# EAGLE design EPGinputRelayA-PIN (EAGLE 7.7.0)
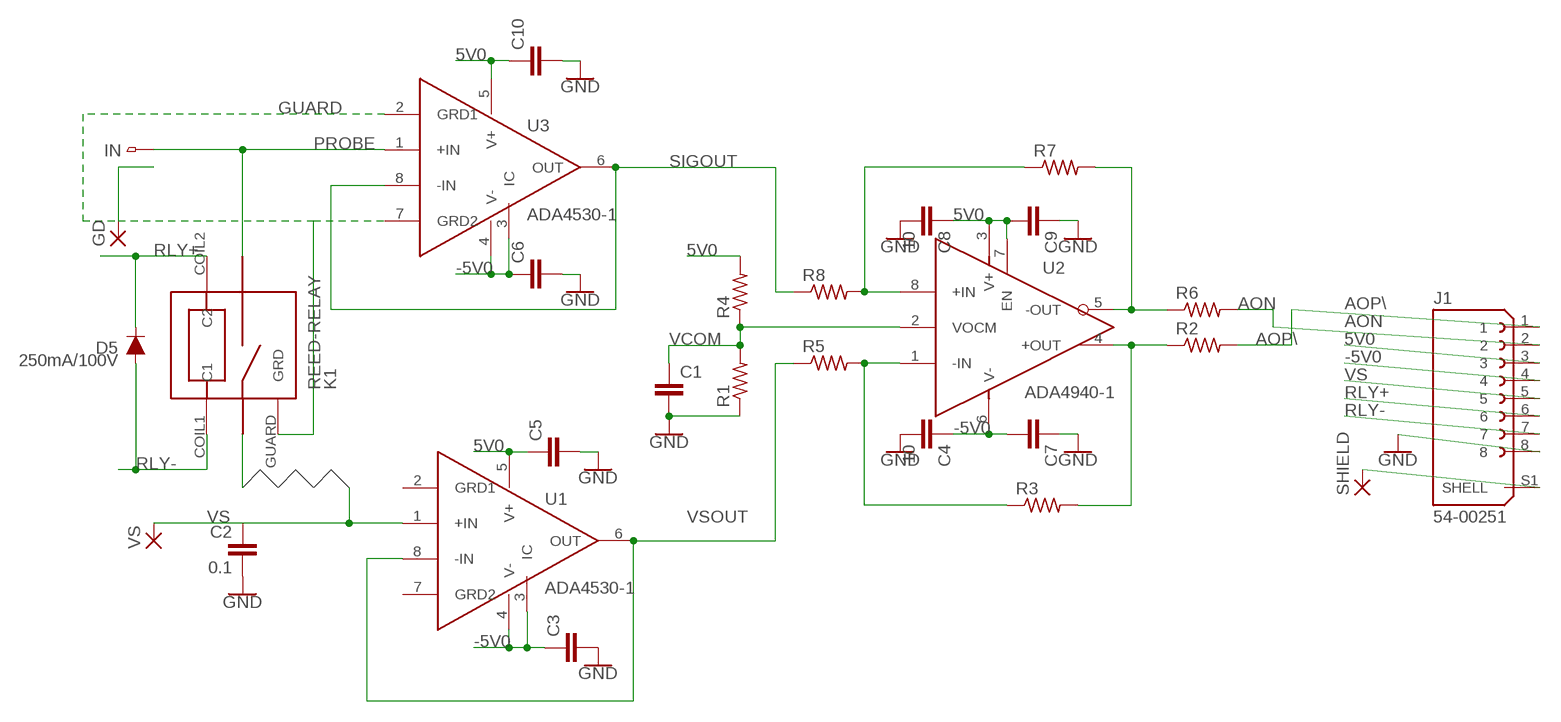
[diagram p0: schematic, sheet 1]

## Parts
C1  CAPS0603S  [0603S]
C2  0.1  CAPS0603S  [0603S]
C3  CAPS0603S  [0603S]
C4  10  CAPS1206S  [1206S]
C5  CAPS0603S  [0603S]
C6  CAPS0603S  [0603S]
C7  CAPS0603S  [0603S]
C8  10  CAPS1206S  [1206S]
C9  CAPS0603S  [0603S]
C10  CAPS0603S  [0603S]
D5  250mA/100V  DIODE-BAS16J  [SOD-323]
GD  2,15/1,0  [2,15/1,0]
IN  PADPAD150  [PAD-150SQ]
J1  54-00251  [54-00251]
K1  REED-RELAY  [MRE05]
R1  RESISTOR_SM0805S  [0805S]
R2  RESISTOR_SM0805S  [0805S]
R3  RESISTOR_SM0805S  [0805S]
R4  RESISTOR_SM0805S  [0805S]
R5  RESISTOR_SM0805S  [0805S]
R6  RESISTOR_SM0805S  [0805S]
R7  RESISTOR_SM0805S  [0805S]
R8  RESISTOR_SM0805S  [0805S]
SHIELD  2,15/1,0  [2,15/1,0]
U1  ADA4530-1  [SOIC-8]
U2  ADA4940-1  [SOIC-8]
U3  ADA4530-1  [SOIC-8]
VS  2,15/1,0  [2,15/1,0]

## Nets
5V0: C5.1 C8.1 C9.2 C10.1 J1.3 R4.2 U1.5(V+) U2.3(V+) U2.7(EN) U3.5(V+)
-5V0: C3.1 C4.1 C6.1 C7.2 J1.4 U1.3(IC) U1.4(V-) U2.6(V-) U3.3(IC) U3.4(V-)
AON: J1.2 R6.2
AOP\: J1.1 R2.2
GND: C1.2 C2.2 C3.2 C4.2 C5.2 C6.2 C7.1 C8.2 C9.1 C10.2 J1.8 R1.1
GUARD: GD.1(P) K1.GUARD(GRD) U3.2(GRD1) U3.7(GRD2)
N$2: J1.S1(SHELL) SHIELD.1(P)
N$6: R7.1 R8.2 U2.8(+IN)
N$7: R3.1 R5.2 U2.1(-IN)
N$19: R2.1 R3.2 U2.4(+OUT)
N$20: R6.1 R7.2 U2.5(-OUT)
PROBE: IN.P$1 U3.1(+IN)
RLY+: D5.C J1.6 K1.COIL2(C2)
RLY-: D5.A J1.7 K1.COIL1(C1)
SIGOUT: R8.1 U3.6(OUT) U3.8(-IN)
VCOM: C1.1 R1.2 R4.1 U2.2(VOCM)
VS: C2.1 J1.5 U1.1(+IN) VS.1(P)
VSOUT: R5.1 U1.6(OUT) U1.8(-IN)
Unconnected: U1.2(GRD1) U1.7(GRD2)

## Library data of the parts
C1-C10 = STEVES_BU:CAPS
D5 = SparkFun-DiscreteSemi:DIODE: Diode These are standard reverse protection diodes and small signal diodes. SparkFun Products: SparkFun SparkPunk Sound Kit <https://www.sparkfun.com/products/11177> SparkFun ESP8266 Thing <https://www.sparkfun.com/products/13231>; PROD_ID: DIO-09646
GD SHIELD VS = wirepad:2,15/1,0: THROUGH-HOLE PAD
IN = jETPAK-ASM:PAD
J1 = 54-00248:54-00251
K1 = EPGinput:REED-RELAY
R1-R8 = STEVES_BU:RESISTOR_SM
U1 U3 = EPG:ADA4530-1
U2 = EPG:ADA4940-1

## Board
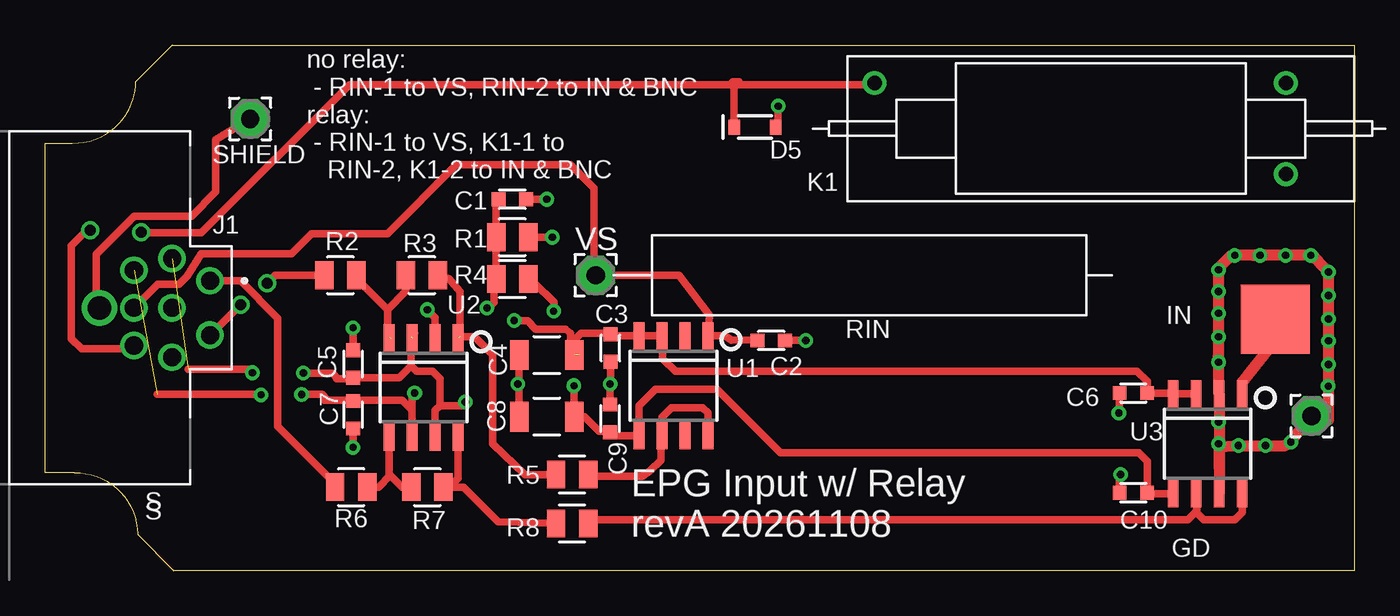
[diagram p1: board, top side]
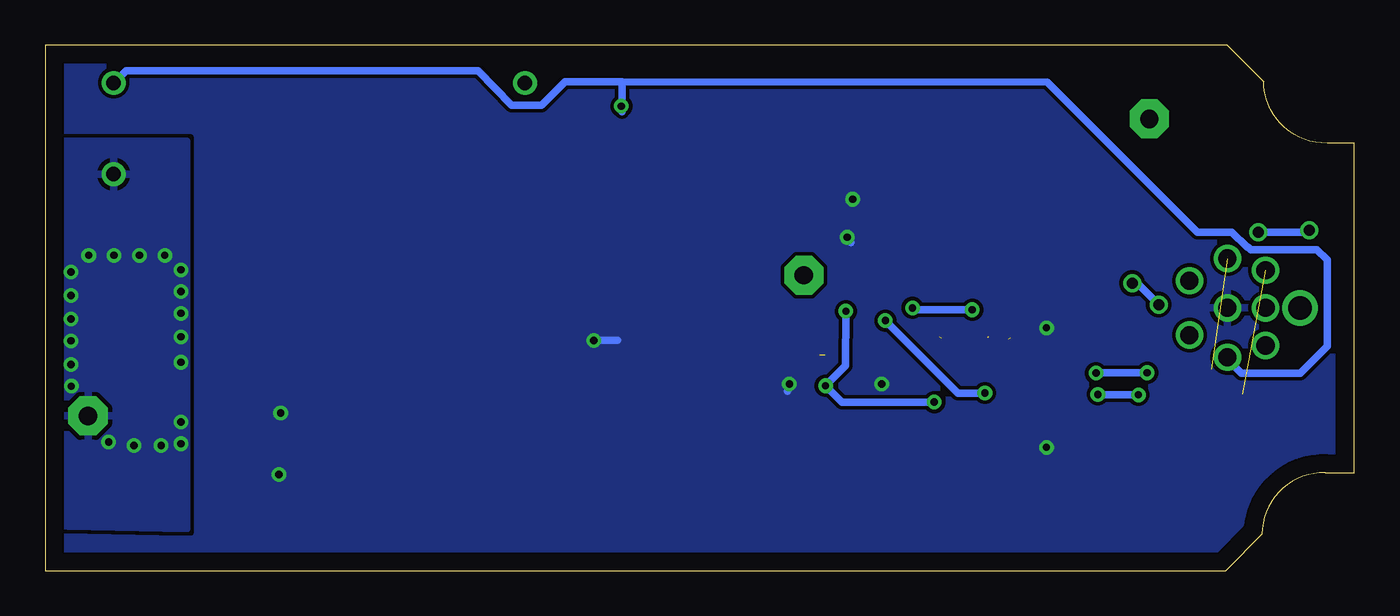
[diagram p2: board, bottom side, seen from below]

Size 72.3 x 29 mm. Coordinates in mm from the lower left corner, seen from the top.
Outline: 0,5.4 0,23.6 1.5,23.6 arc91 5,27 7,29 72.3,29 72.3,0 7.1,0 5.1,2 arc91 1.6,5.4 0,5.4
Copper layers (1*16): Top 0.035mm / dielectric 1.5mm / Bottom 0.035mm
Design rules "default *": minimum track width 10mil, minimum drill 15mil, track to track 8mil, track to pad 7mil, pad to pad 7mil, via to via 8mil, smd to smd 8mil, copper to edge 40mil, drill to drill 8mil, minimum pad ring 10mil, minimum via ring 8mil, stop-mask expansion 4mil, vias tented up to drill 0mil, thermal gap 10mil

### Footprints (pad centres in the part's own frame; a part is rotated, then mirrored left to right if it is on the bottom)
0603S = smd 0.762 x 0.762: 1 -0.762,0; 2 0.762,0
1206S = smd 1.016 x 1.651: 1 -1.524,0; 2 1.524,0
SOD-323 = smd 0.63 x 0.83: A 1.15,0; C -1.15,0
2,15/1,0 = drill 1.016 pad 2.159 octagon: 1 0,0
PAD-150SQ = smd 3.81 x 3.81: P$1 0,0
54-00251 = drill 1 pad 1.4: 1 1.5,2.1; 2 -1.5,2.1; 3 -2.725,0; 4 -2.075,-2.1; 5 0,-2.1; 6 2.075,-2.1; 7 2.725,0; 8 0,0 | drill 1.3 pad 1.7: S1 0,-4
MRE05 = drill 0.8: COIL1 -10.22,-2.52; COIL2 12.5,-2.52; GUARD -10.22,2.52
0805S = smd 1.016 x 1.524: 1 -0.889,0; 2 0.889,0
SOIC-8 = smd 0.6 x 1.5: 1 -1.905,-2.75; 2 -0.635,-2.75; 3 0.635,-2.75; 4 1.905,-2.75; 5 1.905,2.75; 6 0.635,2.75; 7 -0.635,2.75; 8 -1.905,2.75

### Placement (x,y rotation side)
C1  25.8,20.5 0 top
C2  40.1,12.7 0 top
C3  31.22,12.29 270 top
C4  27.7,11.9 180 top
C5  17,11.4 90 top
C6  60.1,9.8 180 top
C7  17,8.6 90 top
C8  27.7,8.5 180 top
C9  31.2,8.4 270 top
C10  60.1,4.3 180 top
D5  39.2,24.48 0 top
GD  69.94,8.54 180 top
IN  67.94,13.88 0 top
J1  7,14.5 270 top
K1  58.3,24.4 180 top
R1  25.8,18.4 180 top
R2  16.3,16.3 180 top
R3  20.8,16.3 180 top
R4  25.8,16.1 0 top
R5  29.1,5.3 180 top
R6  16.9,4.6 180 top
R7  21.1,4.6 180 top
R8  29.1,2.6 180 top
RIN  [1GRES]  45.5,16.3 180 top
SHIELD  11.32,24.94 180 top
U1  34.7,10.2 180 top
U2  20.9,10.1 180 top
U3  64.2,7 180 top
U$1  [BNC]  83.84,14.5 0 top  (outside the outline)
VS  30.4,16.3 0 top

### Tracks (layer width: path | path; a pad name or v marks a point on that pad's centre or on a via)
5V0  (via drill 0.4)  (2 unrouted)
  Top 0.406: U3.5 60.91,4.25 C10.1 60.86,6.04 60.4,6.5 40.6,6.5 37.1,10 33.7,10 32.8,9.1 32.8,7.4 32.9,7.3 32.9,7.34 U1.5 31.61,7.45 C9.2 31.24,7.7 30.6,7.7 29.8,8.5 C8.1 29.2,8.52 v29.2,10.2 | 20.2,11.3 19.54,10.64 C5.1 16.94,10.64 16.9,10.6 16.16,10.6 | 20.2,11.3 20.2,12.9 20.4,13.1 | U2.7 21.54,8.84 21.8,9.1 | 21.8,9.1 21.8,10.6 21.4,11 20.5,11 20.2,11.3 | 21.8,9.1 23,9.1 v23.2,9.3 | R4.2 27,16.1 27,15.9 28.1,14.8 v28.08,14.32 | 16.16,10.6 16.1,10.6 | 7.9,11.1 11.26,11.1 v11.44,10.92 | v14.26,10.9 15.86,10.9 16.16,10.6
  Bottom 0.406: v23.2,9.3 28.3,9.3 v29.2,10.2 28.1,11.3 v28.08,14.32 | v11.44,10.92 14.24,10.92 v14.26,10.9
-5V0  (via drill 0.4)  (2 unrouted)
  Top 0.406: U3.3 U3.4 62.24,9.8 C6.1 60.86,10.44 60.3,11 34.8,11 34.1,11.7 34.1,12.91 U1.3 U1.4 31.32,12.95 C3.1 31.25,13.05 31.3,13.1 29.6,13.1 29.2,12.7 29.2,12.2 | 29.2,12.2 29.5,11.9 | U2.6 20.27,8.84 | 20.27,8.84 19.7,9.4 17.04,9.4 | 17.04,9.4 C7.2 | 20.27,8.84 20.27,9.66 v20.4,9.8 | v25.9,13.8 26.64,13.8 27.08,13.32 28.74,13.32 29,13.1 29,12.4 29.2,12.2 | 15.4,9.4 15.6,9.4 | 15.6,9.4 17.04,9.4 | 6.18,9.74 11.88,9.74 v11.92,9.7 | v14.16,9.72 15.28,9.72 15.6,9.4
  Bottom 0.406: v20.4,9.8 21.9,9.8 v25.9,13.8 | v11.92,9.7 14.14,9.7 v14.16,9.72
AON
  Top 0.406: R6.2 16.01,4.79 12.84,7.96 12.84,13.94 10.78,16 J1.2
AOP\  (via drill 0.6)
  Top 0.406: R2.2 12.7,16.3 v12.26,15.86 | v10.8,14.68 10.78,14.68 J1.1
  Bottom 0.406: v12.26,15.86 11.98,15.86 v10.8,14.68
GND  (via drill 0.4)
  Top 0.406: C6.2 59.34,8.96 v59.3,8.7 | C10.2 59.34,5.24 v59.4,5.3 | C9.1 31.26,9.16 31.2,9.2 31.2,10 v31.2,10.3 31.22,10.32 C3.2 | C5.2 v17,13.4 | C7.1 v17,6.8 | C8.2 26.18,10.3 | 26.18,10.3 26.18,11.72 26,11.9 | C4.2 26.18,10.3 | 26.18,10.3 v26.1,10.3 | C2.2 v42,12.7 | C1.2 v27.7,20.5 | R1.1 v28,18.4
  Bottom 0.406: v59.3,8.7 59.3,8.9 59.2,8.8 | v59.4,5.3 59.4,5.4 | v31.2,10.3 31.3,9.9 | v17,13.4 16.9,13.4 | v17,6.8 16.9,6.8 | v26.1,10.3 26.2,10.3 | v42,12.7 40.7,12.7 | v27.7,20.5 27.6,20.4 | v28,18.4 28,18.3 27.8,18.1
  pour Bottom (rank 2): 72.9,-2 -3.9,-1.8 -3.8,29.1 72.8,30.3
GUARD  (via drill 0.4)
  Top 0.61: U3.2 64.83,6.83 | 64.83,6.83 64.83,5.66 | 64.83,5.66 U3.7 | 64.83,5.66 64.83,6.83 | 64.83,6.83 65.7,6.9 v65.9,6.9 v67.4,6.9 68.5,6.9 69.8,8.2 70.88,8.32 | 70.88,8.32 70.9,10.4 70.88,11.68 v70.88,12.68 v70.88,13.88 v70.88,15.18 v70.88,16.48 70.68,16.68 70.1,17.3 v69.9,17.4 v68.5,17.4 v67.1,17.4 66.7,17.4 65.5,17.4 64.8,16.7 v64.8,15.4 v64.8,14.2 v64.8,12.9 v64.8,11.5 64.8,11.9 64.8,11.4 64.8,9.8 | GD.1 70.88,8.32
  other vias: 65.7,17.4 70.88,11.38 64.8,8.2 64.8,7 68.8,7.1 70.86,10.18 64.8,16.6
  pour Bottom (isolate 1): 73.7,2.5 64.5,2.3 64.5,23.7 73.5,23.7
N$2
  Top 0.406: SHIELD.1 9.42,23.78 9.42,20.9 8.1,19.56 4.9,19.56 2.81,17.45 2.81,14.69 J1.S1
N$6
  Top 0.406: R8.2 25,2.7 23.1,4.6 22.3,4.6 | 22.3,4.6 R7.1 | U2.8 22.8,5.11 22.3,4.6
N$7  (1 unrouted)
  Top 0.406: R5.2 26.5,5.3 24.7,7 24.7,11.9 23.7,12.9 22.9,12.9 22.9,15.4 22.3,16.1 R3.1
N$19  (1 unrouted)
  Top 0.406: R3.2 19.91,15.41 18.9,14.4 | 18.9,14.4 18.9,13 19.1,12.8 | R2.1 17.3,16 18.9,14.4
N$20
  Top 0.406: R7.2 19.7,4.6 19.05,5.25 | 19.05,5.25 19,5.3 U2.5 | R6.1 18.4,4.6 19.05,5.25
PROBE
  Top 0.406: IN.P$1 67.9,13.4 67.9,12.58 67.7,12.38
  Top 0.61: U3.1 66.11,10.41 67.7,12.38 67.8,12.5
RLY+  (via drill 0.6)
  Top 0.406: 37.82,26.82 16.8,26.82 8.62,18.64 5.34,18.64 v5.3,18.68 | 37.82,26.82 45.7,26.82 K1.COIL2 | D5.C 38.05,26.87 38.14,26.96 38.3,26.96 38.32,26.98 37.98,26.98 37.82,26.82 | v2.48,18.78 2.3,18.78 1.44,17.92 1.44,12.8 2,12.24 4.71,12.24 J1.6 4.9,12.36 4.86,12.32
  Bottom 0.406: v5.3,18.68 2.58,18.68 v2.48,18.78
RLY-  (via drill 0.4)
  Top 0.406: D5.A 40.46,24.48 v40.48,25.64
  Bottom 0.406: 40.44,26.98 16.94,26.95 8.68,18.68 6.76,18.68 5.92,17.84 5.84,17.84 5.72,17.72 2.06,17.72 1.5,17.16 1.5,12.38 2.98,10.9 6.24,10.9 6.96,11.62 6.96,11.73 J1.7 | 40.44,26.98 43.6,26.98 44.88,25.68 46.54,25.68 48.38,27.6 67.82,27.6 K1.COIL1 | v40.48,25.64 40.44,25.34 40.44,26.98
SIGOUT
  Top 0.406: U3.8 66.11,3.21 65.7,2.8 64,2.8 63.6,3.2 63.6,3.3 | 63.6,3.3 63.6,4.21 U3.6 | 63.6,3.3 63.1,2.8 33.2,2.8 30.4,2.8 R8.1
VCOM  (via drill 0.4)
  Top 0.406: U2.2 21.54,13.96 v21.1,14.4 | v24.4,14.5 24.5,14.5 24.8,14.8 24.8,15.7 25.1,16 25.01,16 R4.1 R1.2 24.91,20.37 C1.1
  Bottom 0.406: v21.1,14.4 24.3,14.4 v24.4,14.5
VS
  Top 0.406: C2.1 37.9,12.74 37.9,12.7 37.55,12.95 U1.1 36.7,14.1 35,16.3 VS.1 30.3,16.4 30.3,21.1 29,22.4 22.7,22.4 18.9,18.6 14.7,18.6 13.6,17.5 8.6,17.5 7.84,16.24 7.4,15.8 6.22,15.8 4.92,14.5 J1.5
VSOUT
  Top 0.406: U1.8 36.6,8.7 36.3,9 34.6,9 34.06,8.46 U1.6 34,7.38 34,6.1 33.4,5.5 33,5.2 30.4,5.2 R5.1

### Text on the board
tPlace: no relay: / - RIN-1 to VS, RIN-2 to IN & BNC / relay: / - RIN-1 to VS, K1-1 to / RIN-2, K1-2 to IN & BNC | S | S | EPG Input w/ Relay / revA 20261108